# EAGLE design rotor_khamex_4.4 (EAGLE 7.6.0)

## Sheet 1 of 2
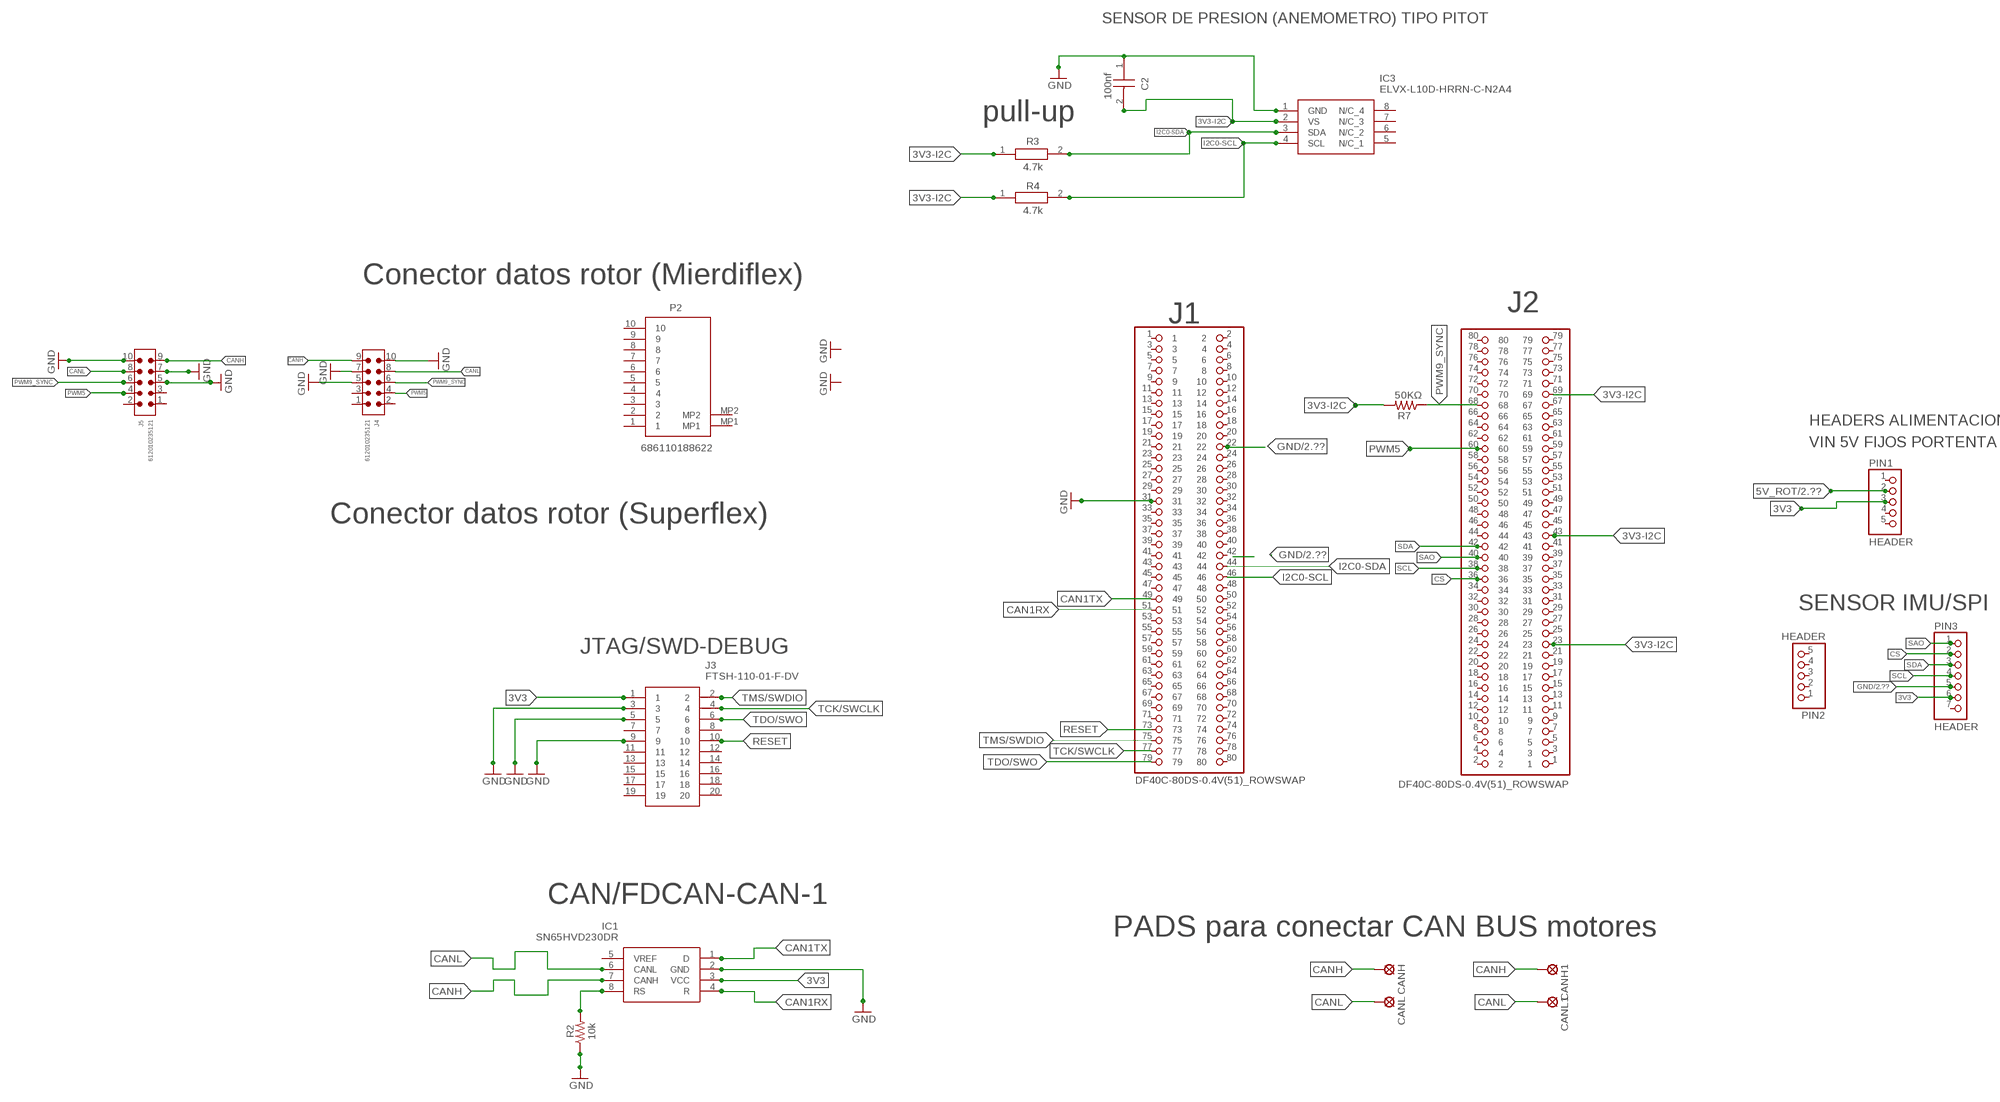
[diagram p0: schematic, sheet 1]

### Parts
C2  100nf  VJ0805Y104KCAAJ  [CAPC2012X145N]
CANH  LSP11  [LSP11]
CANH1  LSP11  [LSP11]
CANL  LSP11  [LSP11]
CANL1  LSP11  [LSP11]
IC1  SN65HVD230DR  [SOT127P600X175-8N]
IC3  ELVX-L10D-HRRN-C-N2A4  [ELVXL10DHRRNCN2A4]
J1  DF40C-80DS-0.4V(51)_ROWSWAP  [HRS_DF40C-80DS-0.4V(51)_ROWSWAP]
J2  DF40C-80DS-0.4V(51)_ROWSWAP  [HRS_DF40C-80DS-0.4V(51)_ROWSWAP]
J3  FTSH-110-01-F-DV  [FTSH-110-XX-YYY-DV]
J4  612010235121  6120XX235121_612010235121  [612010235121]
J5  612010235121  6120XX235121_612010235121  [612010235121]
P2  686110188622  [686110188622]
PIN1  HEADER  PINHD-1X5  [1X05]
PIN2  HEADER  PINHD-1X5  [1X05]
PIN3  HEADER  PINHD-1X7  [1X07]
R2  10k  R-US_M0805  [M0805]
R3  4.7k  CRCW08054K70FKEA  [RESC2012X50N]
R4  4.7k  CRCW08054K70FKEA  [RESC2012X50N]
R7  50KΩ  R-US_M0805  [M0805]

### Nets
3V3: IC1.3(VCC) J3.1 PIN1.3 PIN3.6
3V3-I2C: C2.2 IC3.2(VS) J2.23 J2.43 J2.69 R3.1 R4.1 R7.2
5V_ROT: PIN1.2 ; also sheet 2
CAN1RX: IC1.4(R) J1.51
CAN1TX: IC1.1(D) J1.49
CANH: CANH1.MP CANH.MP IC1.7(CANH) J4.9 J5.9
CANL: CANL1.MP CANL.MP IC1.6(CANL) J4.8 J5.8
CS: J2.36 PIN3.2
GND [power]: C2.1 IC1.2(GND) IC3.1(GND) J1.31 J3.3 J3.5 J3.9 J4.5 J4.7 J4.10 J5.5 J5.7 J5.10 PIN3.5 R2.1 ; also sheet 2
I2C0-SCL: IC3.4(SCL) J1.46 R4.2
I2C0-SDA: IC3.3(SDA) J1.44 R3.2
N$1: J1.22
N$15: IC1.8(RS) R2.2
PWM5: J2.60 J4.4 J5.4
PWM9_SYNC: J2.68 J4.6 J5.6 R7.1
RESET: J1.73 J3.10
SAO: J2.40 PIN3.1
SCL: J2.38 PIN3.4
SDA: J2.42 PIN3.3
TCK/SWCLK: J1.77 J3.4
TDO/SWO: J1.79 J3.6
TMS/SWDIO: J1.75 J3.2
Unconnected: IC1.5(VREF) IC3.5(N/C_1) IC3.6(N/C_2) IC3.7(N/C_3) IC3.8(N/C_4) J1.1 J1.2 J1.3 J1.4 J1.5 J1.6 J1.7 J1.8 J1.9 J1.10 J1.11 J1.12 J1.13 J1.14 J1.15 J1.16 J1.17 J1.18 J1.19 J1.20 J1.21 J1.23 J1.24 J1.25 J1.26 J1.27 J1.28 J1.29 J1.30 J1.32 J1.33 J1.34 J1.35 J1.36 J1.37 J1.38 J1.39 J1.40 J1.41 J1.42 J1.43 J1.45 J1.47 J1.48 J1.50 J1.52 J1.53 J1.54 J1.55 J1.56 J1.57 J1.58 J1.59 J1.60 J1.61 J1.62 J1.63 J1.64 J1.65 J1.66 J1.67 J1.68 J1.69 J1.70 J1.71 J1.72 J1.74 J1.76 J1.78 J1.80 J2.1 J2.2 J2.3 J2.4 J2.5 J2.6 J2.7 J2.8 J2.9 J2.10 J2.11 J2.12 J2.13 J2.14 J2.15 J2.16 J2.17 J2.18 J2.19 J2.20 J2.21 J2.22 J2.24 J2.25 J2.26 J2.27 J2.28 J2.29 J2.30 J2.31 J2.32 J2.33 J2.34 J2.35 J2.37 J2.39 J2.41 J2.44 J2.45 J2.46 J2.47 J2.48 J2.49 J2.50 J2.51 J2.52 J2.53 J2.54 J2.55 J2.56 J2.57 J2.58 J2.59 J2.61 J2.62 J2.63 J2.64 J2.65 J2.66 J2.67 J2.70 J2.71 J2.72 J2.73 J2.74 J2.75 J2.76 J2.77 J2.78 J2.79 J2.80 J3.7 J3.8 J3.11 J3.12 J3.13 J3.14 J3.15 J3.16 J3.17 J3.18 J3.19 J3.20 J4.1 J4.2 J4.3 J5.1 J5.2 J5.3 P2.1 P2.2 P2.3 P2.4 P2.5 P2.6 P2.7 P2.8 P2.9 P2.10 P2.MP1 P2.MP2 PIN1.1 PIN1.4 PIN1.5 PIN2.1 PIN2.2 PIN2.3 PIN2.4 PIN2.5 PIN3.7

### Notes on the sheet
- SENSOR DE PRESION (ANEMOMETRO) TIPO PITOT
- pull-up
- 4.7k
- 4.7k
- Conector datos rotor (Mierdiflex)
- HEADERS ALIMENTACION
- VIN 5V FIJOS PORTENTA
- Conector datos rotor (Superflex)
- SENSOR IMU/SPI
- JTAG/SWD-DEBUG
- CAN/FDCAN-CAN-1
- PADS para conectar CAN BUS motores

## Sheet 2 of 2
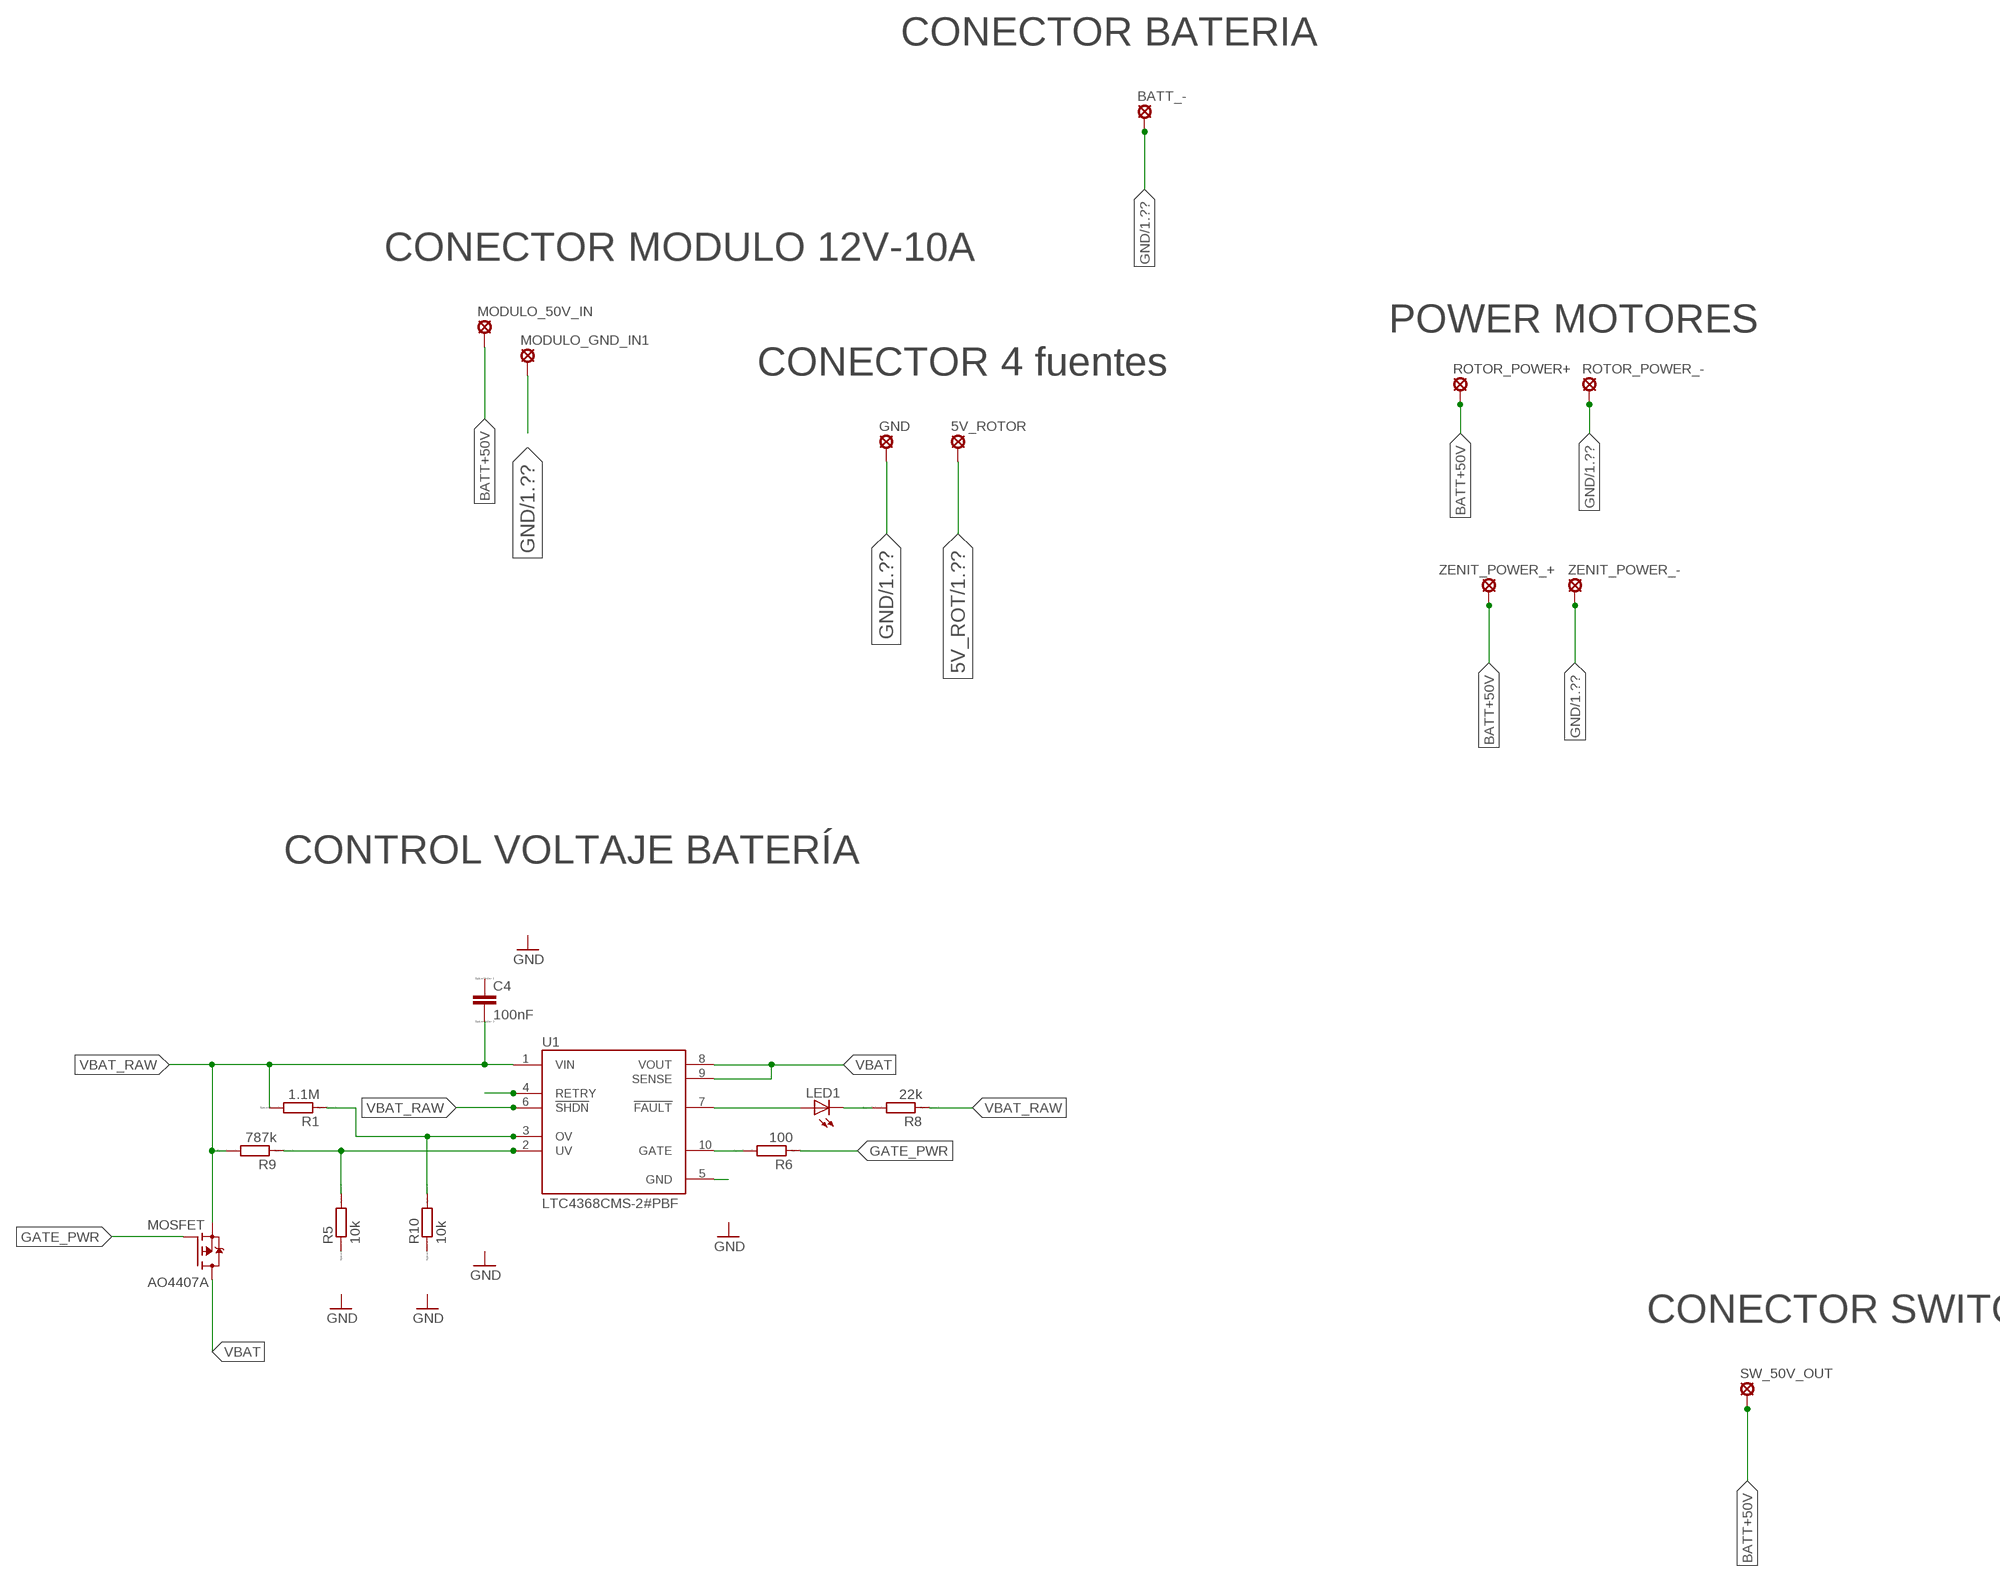
[diagram p1: schematic, sheet 2]

### Parts
5V_ROTOR  SE14  [SE14]
BATT_-  SE14  [SE14]
C4  100nF  C  [C0805]
GND  SE14  [SE14]
LED1  LED  [SMARTLED-TTW]
MODULO_50V_IN  SE14  [SE14]
MODULO_GND_IN1  SE14  [SE14]
MOSFET  AO4407A  [SOIC127P600X175-8N]
R1  1.1M  R  [R0805]
R5  10k  R  [R0805]
R6  100  R  [R0805]
R8  22k  R  [R0805]
R9  787k  R  [R0805]
R10  10k  R  [R0805]
ROTOR_POWER+  SE14  [SE14]
ROTOR_POWER_-  SE14  [SE14]
SW_50V_OUT  SE14  [SE14]
U1  LTC4368CMS-2#PBF  [SOP50P490X110-10N]
ZENIT_POWER_+  SE14  [SE14]
ZENIT_POWER_-  SE14  [SE14]

### Nets
5V_ROT: 5V_ROTOR.MP ; also sheet 1
BATT+50V [power]: MODULO_50V_IN.MP ROTOR_POWER+.MP SW_50V_OUT.MP ZENIT_POWER_+.MP
GATE_PWR: MOSFET.4(G) R6.1
GND [power]: BATT_-.MP GND.MP MODULO_GND_IN1.MP ROTOR_POWER_-.MP ZENIT_POWER_-.MP ; also sheet 1
N$2: LED1.A@1(A) U1.7(!FAULT)
N$11: R5.2 R9.1 U1.2(UV)
N$12: R1.1 R10.2 U1.3(OV)
N$13: LED1.C@1(C) R8.2
N$14: R6.2 U1.10(GATE)
N$20 [power]: U1.4(RETRY)
N$21 [power]: U1.5(GND)
VBAT: MOSFET.5(D) MOSFET.6(D) MOSFET.7(D) MOSFET.8(D) U1.8(VOUT) U1.9(SENSE)
VBAT_RAW: C4.2 MOSFET.1(S) MOSFET.2(S) MOSFET.3(S) R1.2 R8.1 R9.2 U1.1(VIN) U1.6(!SHDN)
Unconnected: C4.1 R5.1 R10.1

### Notes on the sheet
- CONECTOR BATERIA
- CONECTOR MODULO 12V-10A
- POWER MOTORES
- CONECTOR 4 fuentes
- CONTROL VOLTAJE BATERÍA
- CONECTOR SWITCH

## Library data of the parts
5V_ROTOR BATT_- GND MODULO_50V_IN MODULO_GND_IN1 ROTOR_POWER+ ROTOR_POWER_- SW_50V_OUT ZENIT_POWER_+ ZENIT_POWER_- = solpad:SE14: SOLDER PAD E1553, drill 1,4mm, distributor Buerklin, 07F820
C2 = VJ0805Y104KCAAJ:VJ0805Y104KCAAJ: Vishay VJ0805 series Capacitor Chips Source: Datasheet <http://www.vishay.com/docs/45226/vj31xrohsautomlcc.pdf>; DESCRIPTION: Vishay VJ0805 series Capacitor Chips; HEIGHT: 1.45mm; MANUFACTURER_NAME: Vishay; MANUFACTURER_PART_NUMBER: VJ0805Y104KCAAJ
C4 = eagle-ltspice:C: CAPACITOR, European symbol; SPICEMODEL: NONE; SPICEPREFIX: C
CANH CANH1 CANL CANL1 = solpad:LSP11: SOLDER PAD drill 1.1 mm
IC1 = SN65HVD230DR:SN65HVD230DR: 3.3 V CAN Transceiver with Standby Mode Source: Datasheet <http://www.ti.com/lit/gpn/sn65hvd230>; DESCRIPTION: 3.3 V CAN Transceiver with Standby Mode; HEIGHT: 1.75mm; MANUFACTURER_NAME: Texas Instruments; MANUFACTURER_PART_NUMBER: SN65HVD230DR; MOUSER_PART_NUMBER: 595-SN65HVD230DR; MOUSER_PRICE-STOCK: https://www.mouser.co.uk/ProductDetail/Texas-Instruments/SN65HVD230DR?qs=QViXGNcIEAtifeQR3pYVUQ%3D%3D
IC3 = ELVX-L10D-HRRN-C-N2A4:ELVX-L10D-HRRN-C-N2A4: Pressure Sensor +/-0.36PSI (+/-2.49kPa) Differential Male - 0.08" (1.93mm) Tube, Dual 14 b 8-SMD, No Lead, Dual Ports, Same Side, 3.3V, -25C ~ 85C Source: Datasheet <https://allsensors.com/hubfs/Product-Data-Sheets/DS-0452.pdf>; DESCRIPTION: Pressure Sensor +/-0.36PSI (+/-2.49kPa) Differential Male - 0.08" (1.93mm) Tube, Dual 14 b 8-SMD, No Lead, Dual Ports, Same Side, 3.3V, -25C ~ 85C; HEIGHT: 4.33mm; MANUFACTURER_NAME: Amphenol; MANUFACTURER_PART_NUMBER: ELVX-L10D-HRRN-C-N2A4
J1 J2 = DF40C-80DS-0.4V_51_ROWSWAP:DF40C-80DS-0.4V(51)_ROWSWAP; CHECK_PRICES: https://www.snapeda.com/parts/DF40C-80DS-0.4V(51)/Hirose/view-part/?ref=eda; DESCRIPTION: Receptáculo del conector de la posición 80, contactos de la tira central Montaje en superficie Oro; DIGIKEY_PART_NUMBER: H11633CT-ND; MF: Hirose; MP: DF40C-80DS-0.4V(51); PACKAGE: None; SNAPEDA_LINK: https://www.snapeda.com/parts/DF40C-80DS-0.4V(51)/Hirose/view-part/?ref=snap
J3 = FTSH-110-01-F-DV:FTSH-110-01-F-DV: 20 Position, High Reliability Header Strips, 0.050" pitch Source: Datasheet <http://suddendocs.samtec.com/prints/ftsh-1xx-xx-xxx-dv-xxx-xxx-mkt.pdf>; DESCRIPTION: 20 Position, High Reliability Header Strips, 0.050&quot; pitch; HEIGHT: mm; MANUFACTURER_NAME: SAMTEC; MANUFACTURER_PART_NUMBER: FTSH-110-01-F-DV; MOUSER_PART_NUMBER: 200-FTSH11001FDV; MOUSER_PRICE-STOCK: https://www.mouser.co.uk/ProductDetail/Samtec/FTSH-110-01-F-DV?qs=92ilVni64gw1JaTDl9rCLg%3D%3D
J4 J5 = Eagle_WR-BHD_rev24a:6120XX235121_612010235121: WR-BHD 2.54 mm Male Box Header High Temperature KIND PROPERTIES: Pitch 2.54 mm Gender:Male MATERIAL PROPERTIES: Insulator Material:PA6T Insulator Flammability Rating UL94 V-0 Insulator Color:Black Contact Material :Copper Alloy Contact Plating :Gold Contact Type: Stamped GENERAL INFORMATION: Operating Temperature:-40 °C up to +125 °C Compliance:RoHS Working Voltage: 250 V (AC) Withstanding Voltage:500 V (AC) Contact Resistance: 20 mΩ Insulation Resistance:1000 MΩ PACKAGING PROPERTIES Packaging :Tray <https://www.we-online.com/catalog/media/o32904v209%20Family_WR-BHD_6120xx235121.jpg> Details see: https://www.we-online.com/catalog/en/BHD_2_54_MALE_BOX_HEADER_HIGH_TEMPERATURE_6120XX235121 Updated by Ella Wu 2021-03-12 2021 (C) Würth Elektronik; CONTACT-RESISTANCE: 20mOhm; DATASHEET-URL: https://www.we-online.com/redexpert/spec/612010235121?ae; GENDER: Male; IR: 3A; LENGTH: 20.3mm; MOUNT: THT; PACKAGING: Tray; PART-NUMBER: 612010235121; PINS: 10; PITCH: 2.54mm; TYPE: Straight; WORKING-VOLTAGE: 250V(AC)
LED1 = led:LED: LED OSRAM: - CHIPLED LG R971, LG N971, LY N971, LG Q971, LY Q971, LO R971, LY R971 LH N974, LH R974 LS Q976, LO Q976, LY Q976 LO Q996 - Hyper CHIPLED LW Q18S LB Q993, LB Q99A, LB R99A - SideLED LS A670, LO A670, LY A670, LG A670, LP A670 LB A673, LV A673, LT A673, LW A673 LH A674 LY A675 LS A676, LA A676, LO A676, LY A676, LW A676 LS A679, LY A679, LG A679 - Hyper Micro SIDELED® LS Y876, LA Y876, LO Y876, LY Y876 LT Y87S - SmartLED LW L88C, LW L88S LB L89C, LB L89S, LG L890 LS L89K, LO L89K, LY L89K LS L896, LA L896, LO L896, LY L896 - TOPLED LS T670, LO T670, LY T670, LG T670, LP T670 LSG T670, LSP T670, LSY T670, LOP T670, LYG T670 LG T671, LOG T671, LSG T671 LB T673, LV T673, LT T673, LW T673 LH T674 LS T676, LA T676, LO T676, LY T676, LB T676, LH T676, LSB T676, LW T676 LB T67C, LV T67C, LT T67C, LS T67K, LO T67K, LY T67K, LW E67C LS E67B, LA E67B, LO E67B, LY E67B, LB E67C, LV E67C, LT E67C LW T67C LS T679, LY T679, LG T679 LS T770, LO T770, LY T770, LG T770, LP T770 LB T773, LV T773, LT T773, LW T773 LH T774 LS E675, LA E675, LY E675, LS T675 LS T776, LA T776, LO T776, LY T776, LB T776 LHGB T686 LT T68C, LB T68C - Hyper Mini TOPLED® LB M676 - Mini TOPLED Santana® LG M470 LS M47K, LO M47K, LY M47K Source: http://www.osram.convergy.de LUXEON: - LUMILED® LXK2-PW12-R00, LXK2-PW12-S00, LXK2-PW14-U00, LXK2-PW14-V00 LXK2-PM12-R00, LXK2-PM12-S00, LXK2-PM14-U00 LXK2-PE12-Q00, LXK2-PE12-R00, LXK2-PE12-S00, LXK2-PE14-T00, LXK2-PE14-U00 LXK2-PB12-K00, LXK2-PB12-L00, LXK2-PB12-M00, LXK2-PB14-N00, LXK2-PB14-P00, LXK2-PB14-Q00 LXK2-PR12-L00, LXK2-PR12-M00, LXK2-PR14-Q00, LXK2-PR14-R00 LXK2-PD12-Q00, LXK2-PD12-R00, LXK2-PD12-S00 LXK2-PH12-R00, LXK2-PH12-S00 LXK2-PL12-P00, LXK2-PL12-Q00, LXK2-PL12-R00 Source: www.luxeon.com KINGBRIGHT: KA-3528ASYC Source: www.kingbright.com
MOSFET = AO4407A:AO4407A: Check availability <https://pricing.snapeda.com/parts/AO4407A/Alpha%20%26/view-part?ref=eda>; AVAILABILITY: In Stock; CHECK_PRICES: https://www.snapeda.com/parts/AO4407A/Alpha/view-part/?ref=eda; DESCRIPTION: P-Channel 30 V 12A (Ta) 3.1W (Ta) Surface Mount 8-SOIC; MF: Alpha &; MP: AO4407A; PACKAGE: SOIC-8 Alpha &amp; Omega Semiconductor; PRICE: None; SNAPEDA_LINK: https://www.snapeda.com/parts/AO4407A/Alpha/view-part/?ref=snap
P2 = 686110188622:686110188622: FFC & FPC Connectors WR-FPC 1,0mm SMT Horiz. Top Contact Tin Plating{0000} Source: Datasheet <https://www.mouser.ch/datasheet/2/445/686110188622-1843591.pdf>; DESCRIPTION: FFC & FPC Connectors WR-FPC 1,0mm SMT Horiz. Top Contact Tin Plating{0000}; HEIGHT: 3.3mm; MANUFACTURER_NAME: Wurth Elektronik; MANUFACTURER_PART_NUMBER: 686110188622; MOUSER_PART_NUMBER: 710-686110188622; MOUSER_PRICE-STOCK: https://www.mouser.co.uk/ProductDetail/Wurth-Elektronik/686110188622?qs=OlC7AqGiEDnHUpT6yh27Lg%3D%3D
PIN1 PIN2 = pinhead:PINHD-1X5: PIN HEADER
PIN3 = pinhead:PINHD-1X7: PIN HEADER
R1 R5 R6 R8-R10 = eagle-ltspice:R: RESISTOR, European symbol; SPICEMODEL: NONE; SPICEPREFIX: R
R2 R7 = rcl:R-US_: RESISTOR, American symbol
R3 R4 = CRCW08054K70FKEA:CRCW08054K70FKEA: Vishay CRCW Series Thick Film Surface Mount Resistor 805 Case 4.7k +/-1% 0.125W +/-100ppm/C Source: Datasheet <http://www.vishay.com/docs/20035/dcrcwe3.pdf>; DESCRIPTION: Vishay CRCW Series Thick Film Surface Mount Resistor 805 Case 4.7k +/-1% 0.125W +/-100ppm/C; HEIGHT: 0.5mm; MANUFACTURER_NAME: Vishay; MANUFACTURER_PART_NUMBER: CRCW08054K70FKEA; MOUSER_PART_NUMBER: 71-CRCW0805-4.7K-E3; MOUSER_PRICE-STOCK: https://www.mouser.co.uk/ProductDetail/Vishay-Dale/CRCW08054K70FKEA?qs=kkyyugUlSrMIzNiWjd4LGQ%3D%3D
U1 = LTC4368CMS-2_PBF:LTC4368CMS-2#PBF: Check availability <https://pricing.snapeda.com/parts/LTC4368CMS-2%23PBF/Analog%20Devices/view-part?ref=eda>; AVAILABILITY: In Stock; CHECK_PRICES: https://www.snapeda.com/parts/LTC4368CMS-2%23PBF/Analog+Devices/view-part/?ref=eda; DESCRIPTION: 100V UV/OV and Reverse Protection Controller with Bidirectional Circuit Breaker; MF: Analog Devices; MP: LTC4368CMS-2#PBF; PACKAGE: MSOP-10 Analog Devices; PRICE: None; SNAPEDA_LINK: https://www.snapeda.com/parts/LTC4368CMS-2%23PBF/Analog+Devices/view-part/?ref=snap

## Net classes
0 default: width 0.152 mm, drill 0.305 mm, clearance 0.152 mm
1 power: width 0.127 mm, drill 0.305 mm, clearance 0.127 mm
2 thin: width 0.508 mm, drill 0.305 mm, clearance 0.152 mm

## Board
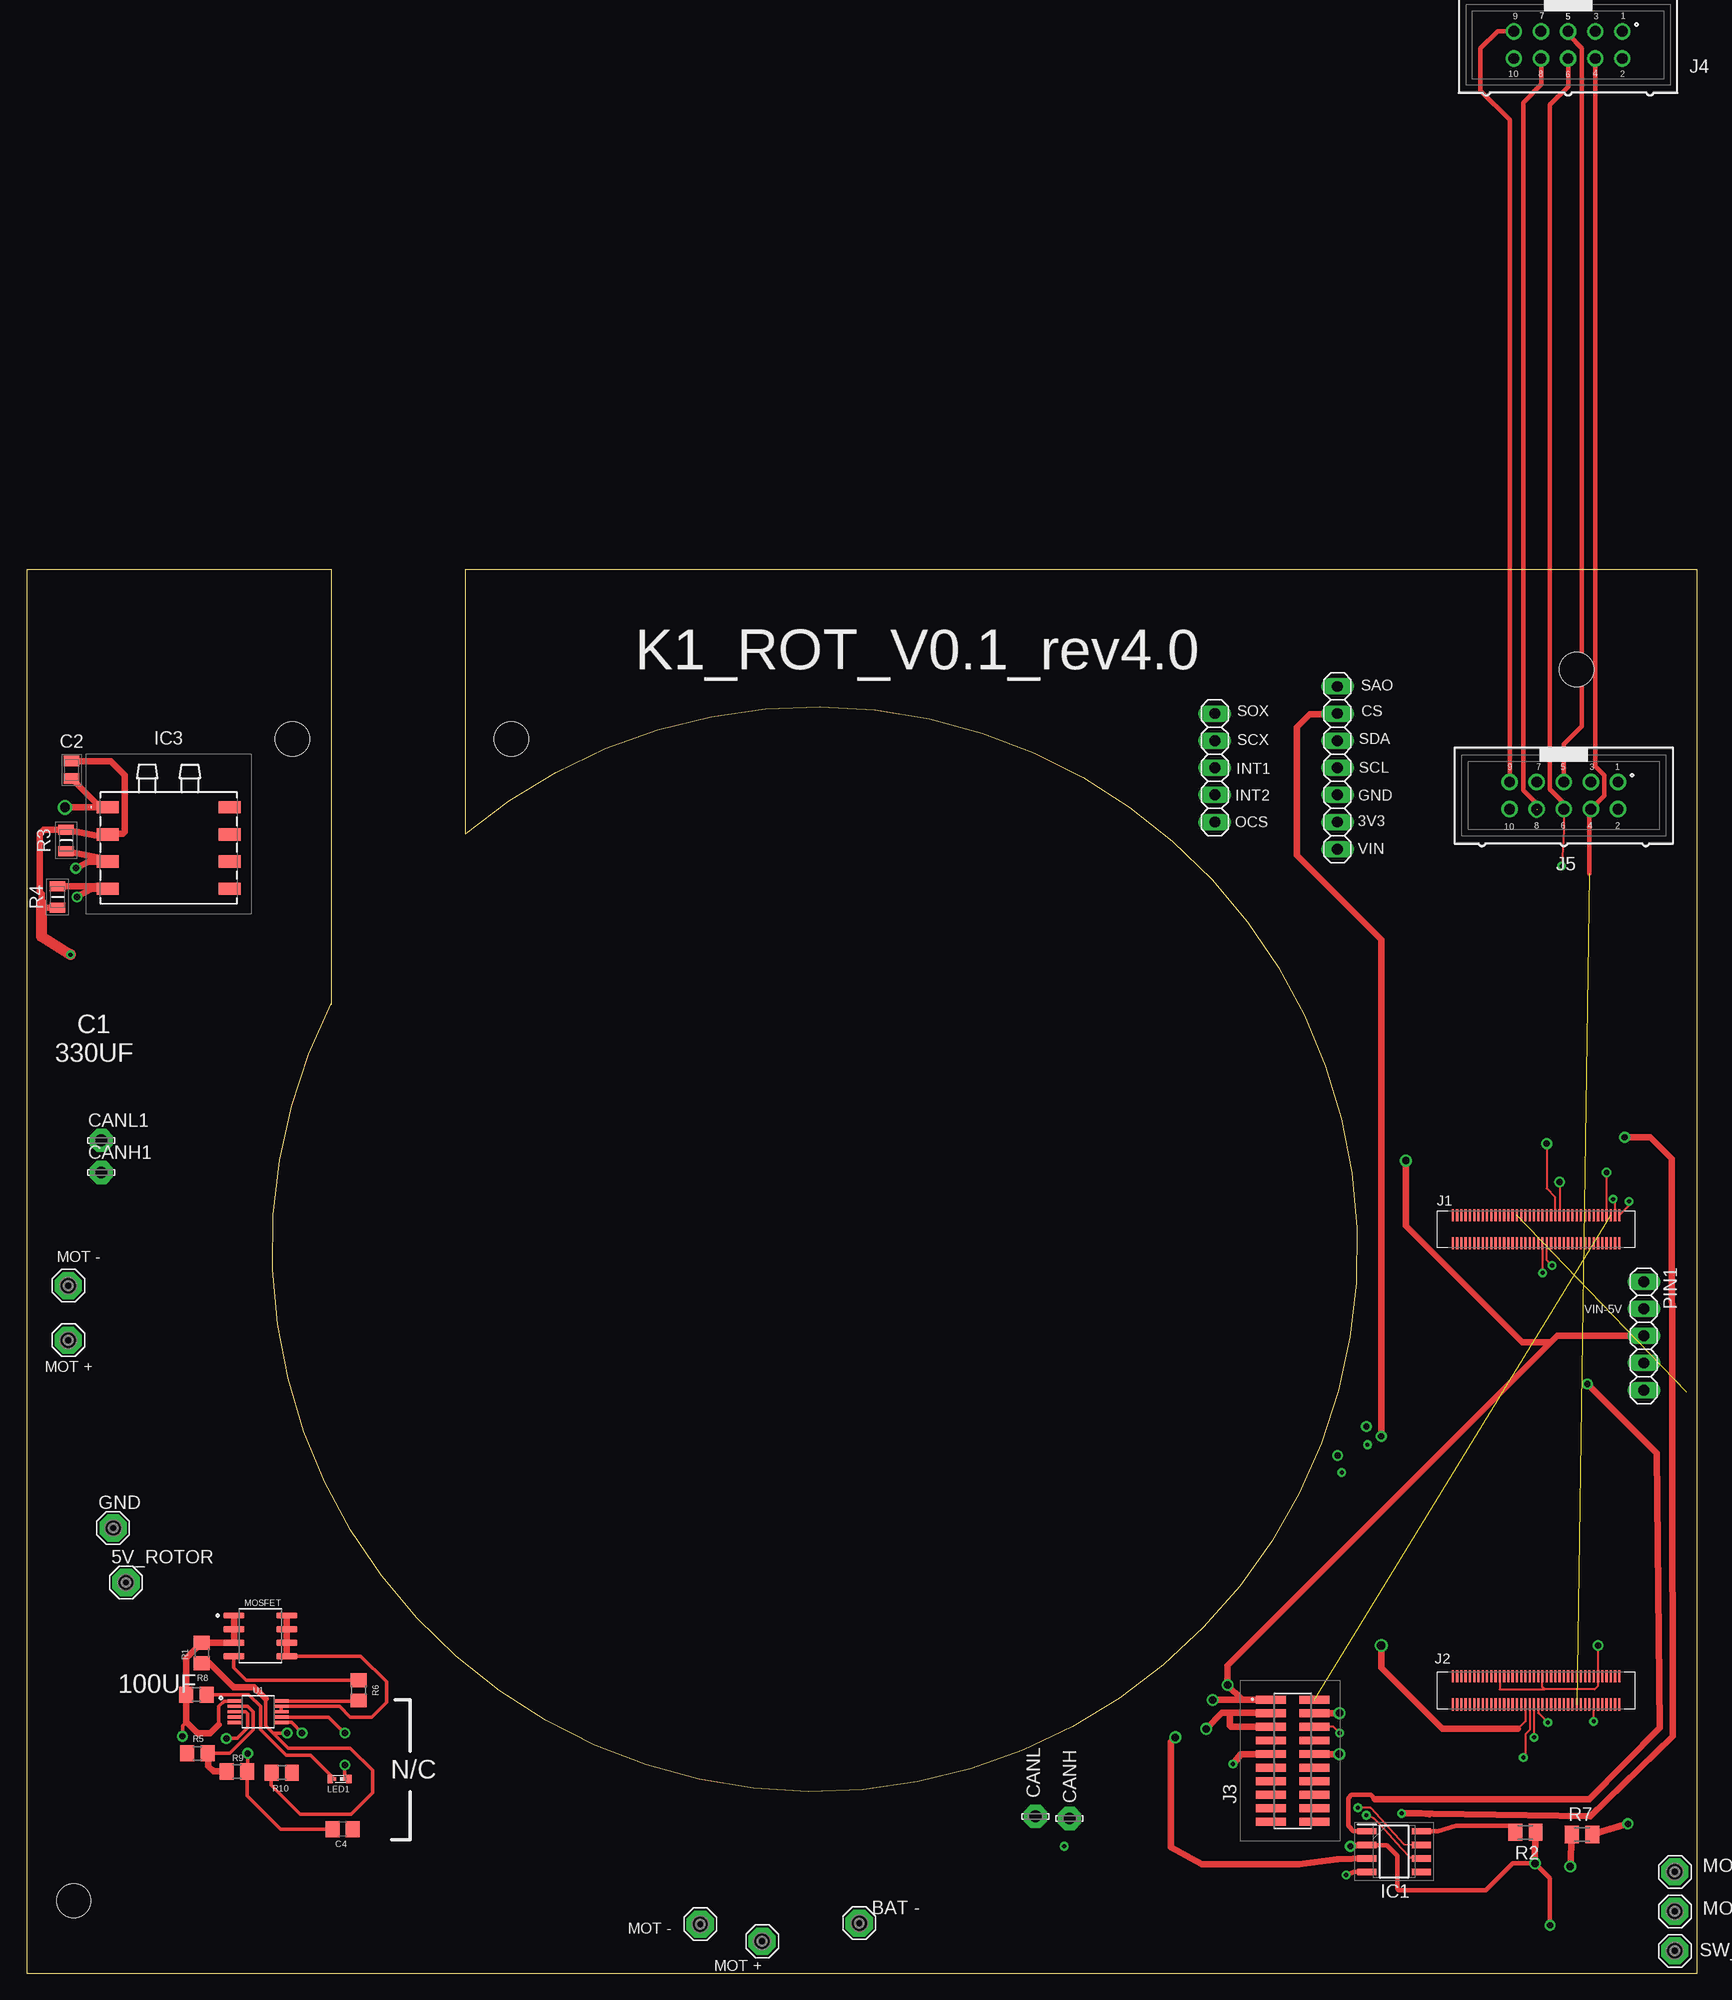
[diagram p2: board, top side]
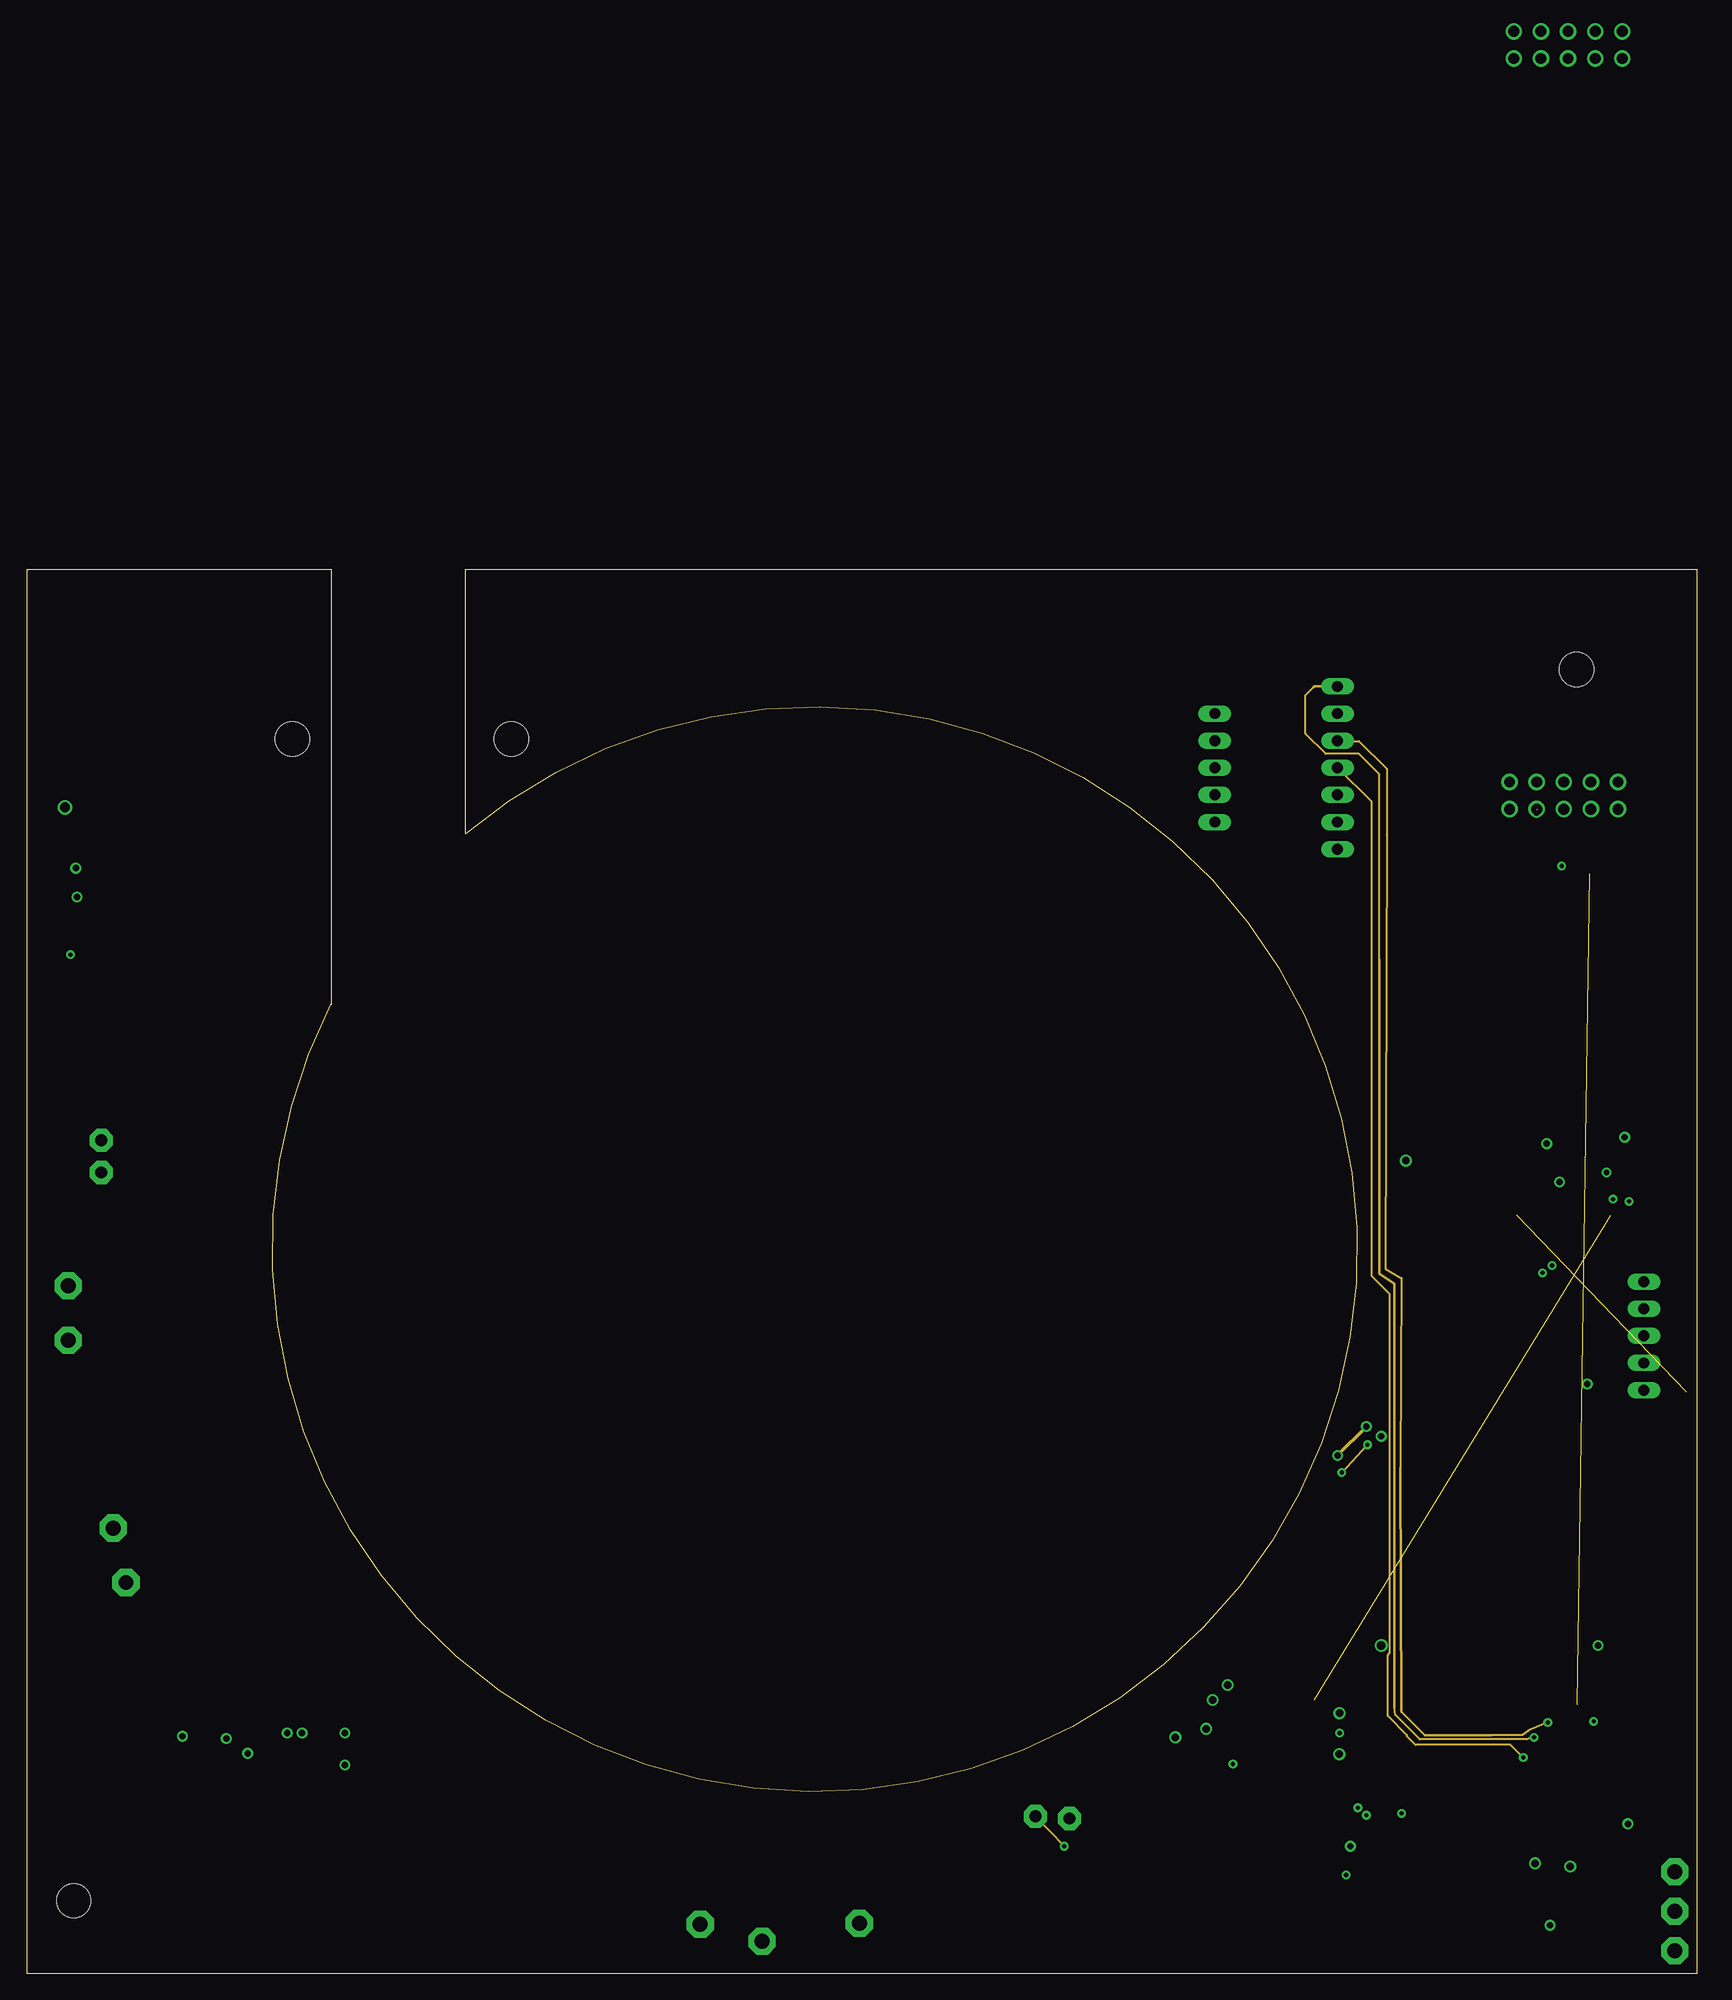
[diagram p3: board, inner layer Route2]
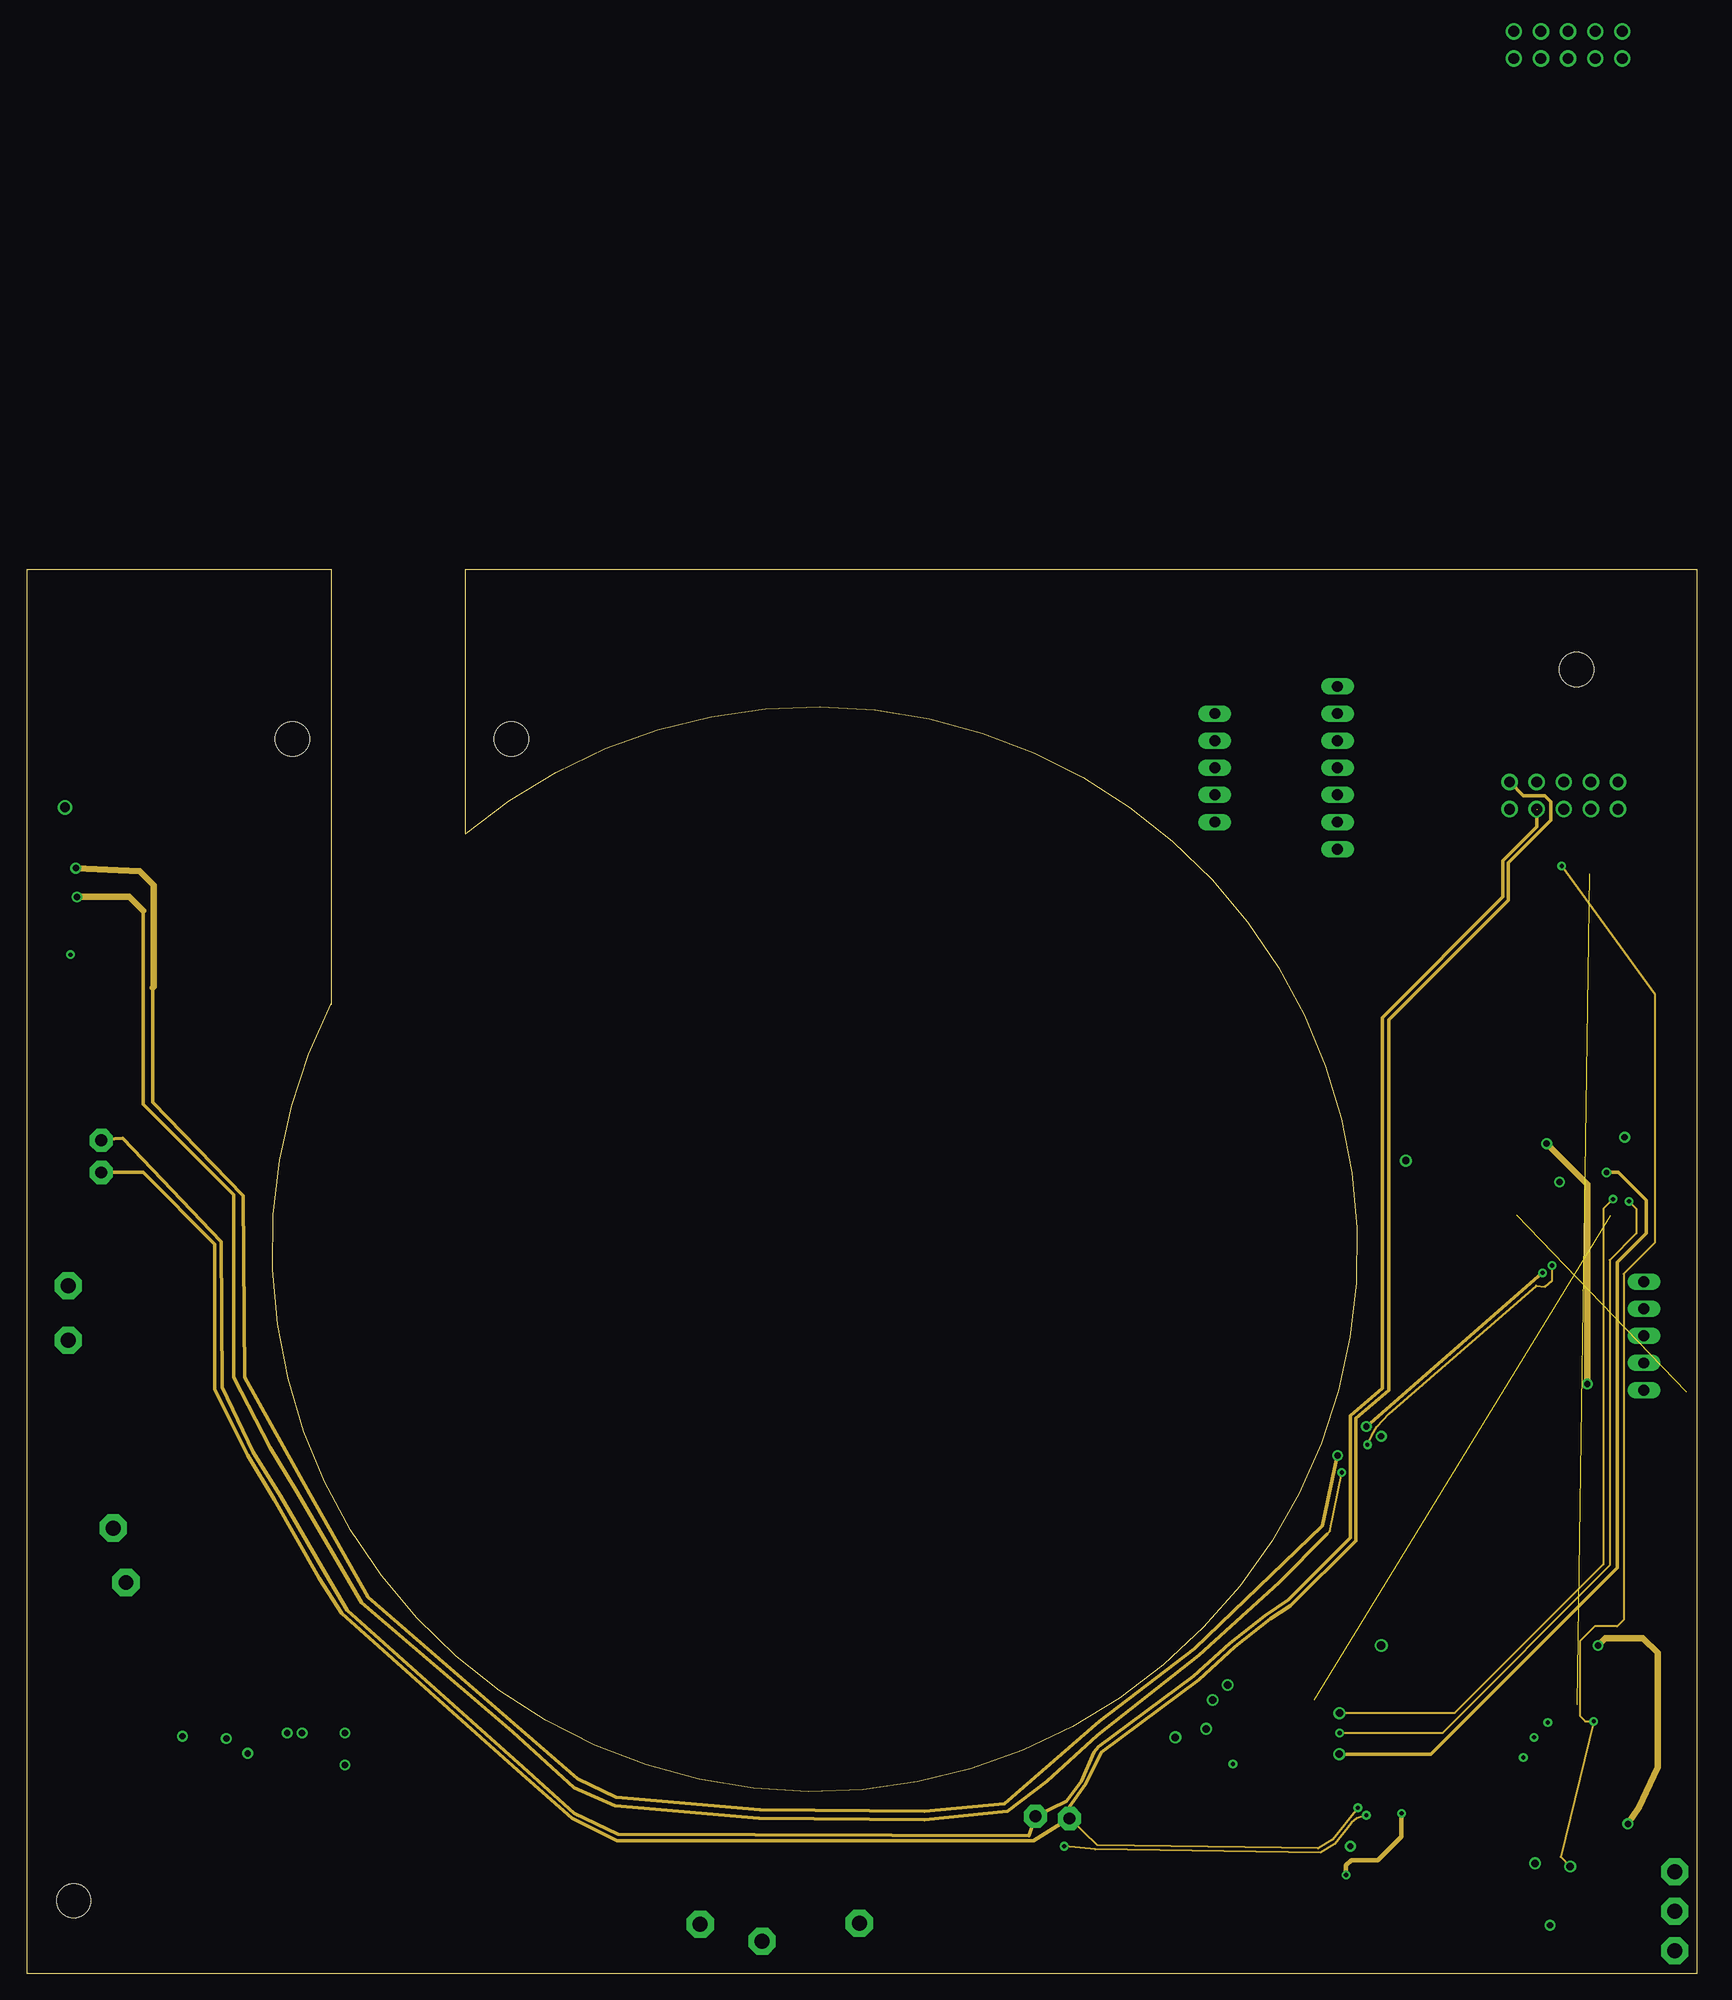
[diagram p4: board, inner layer Route15]
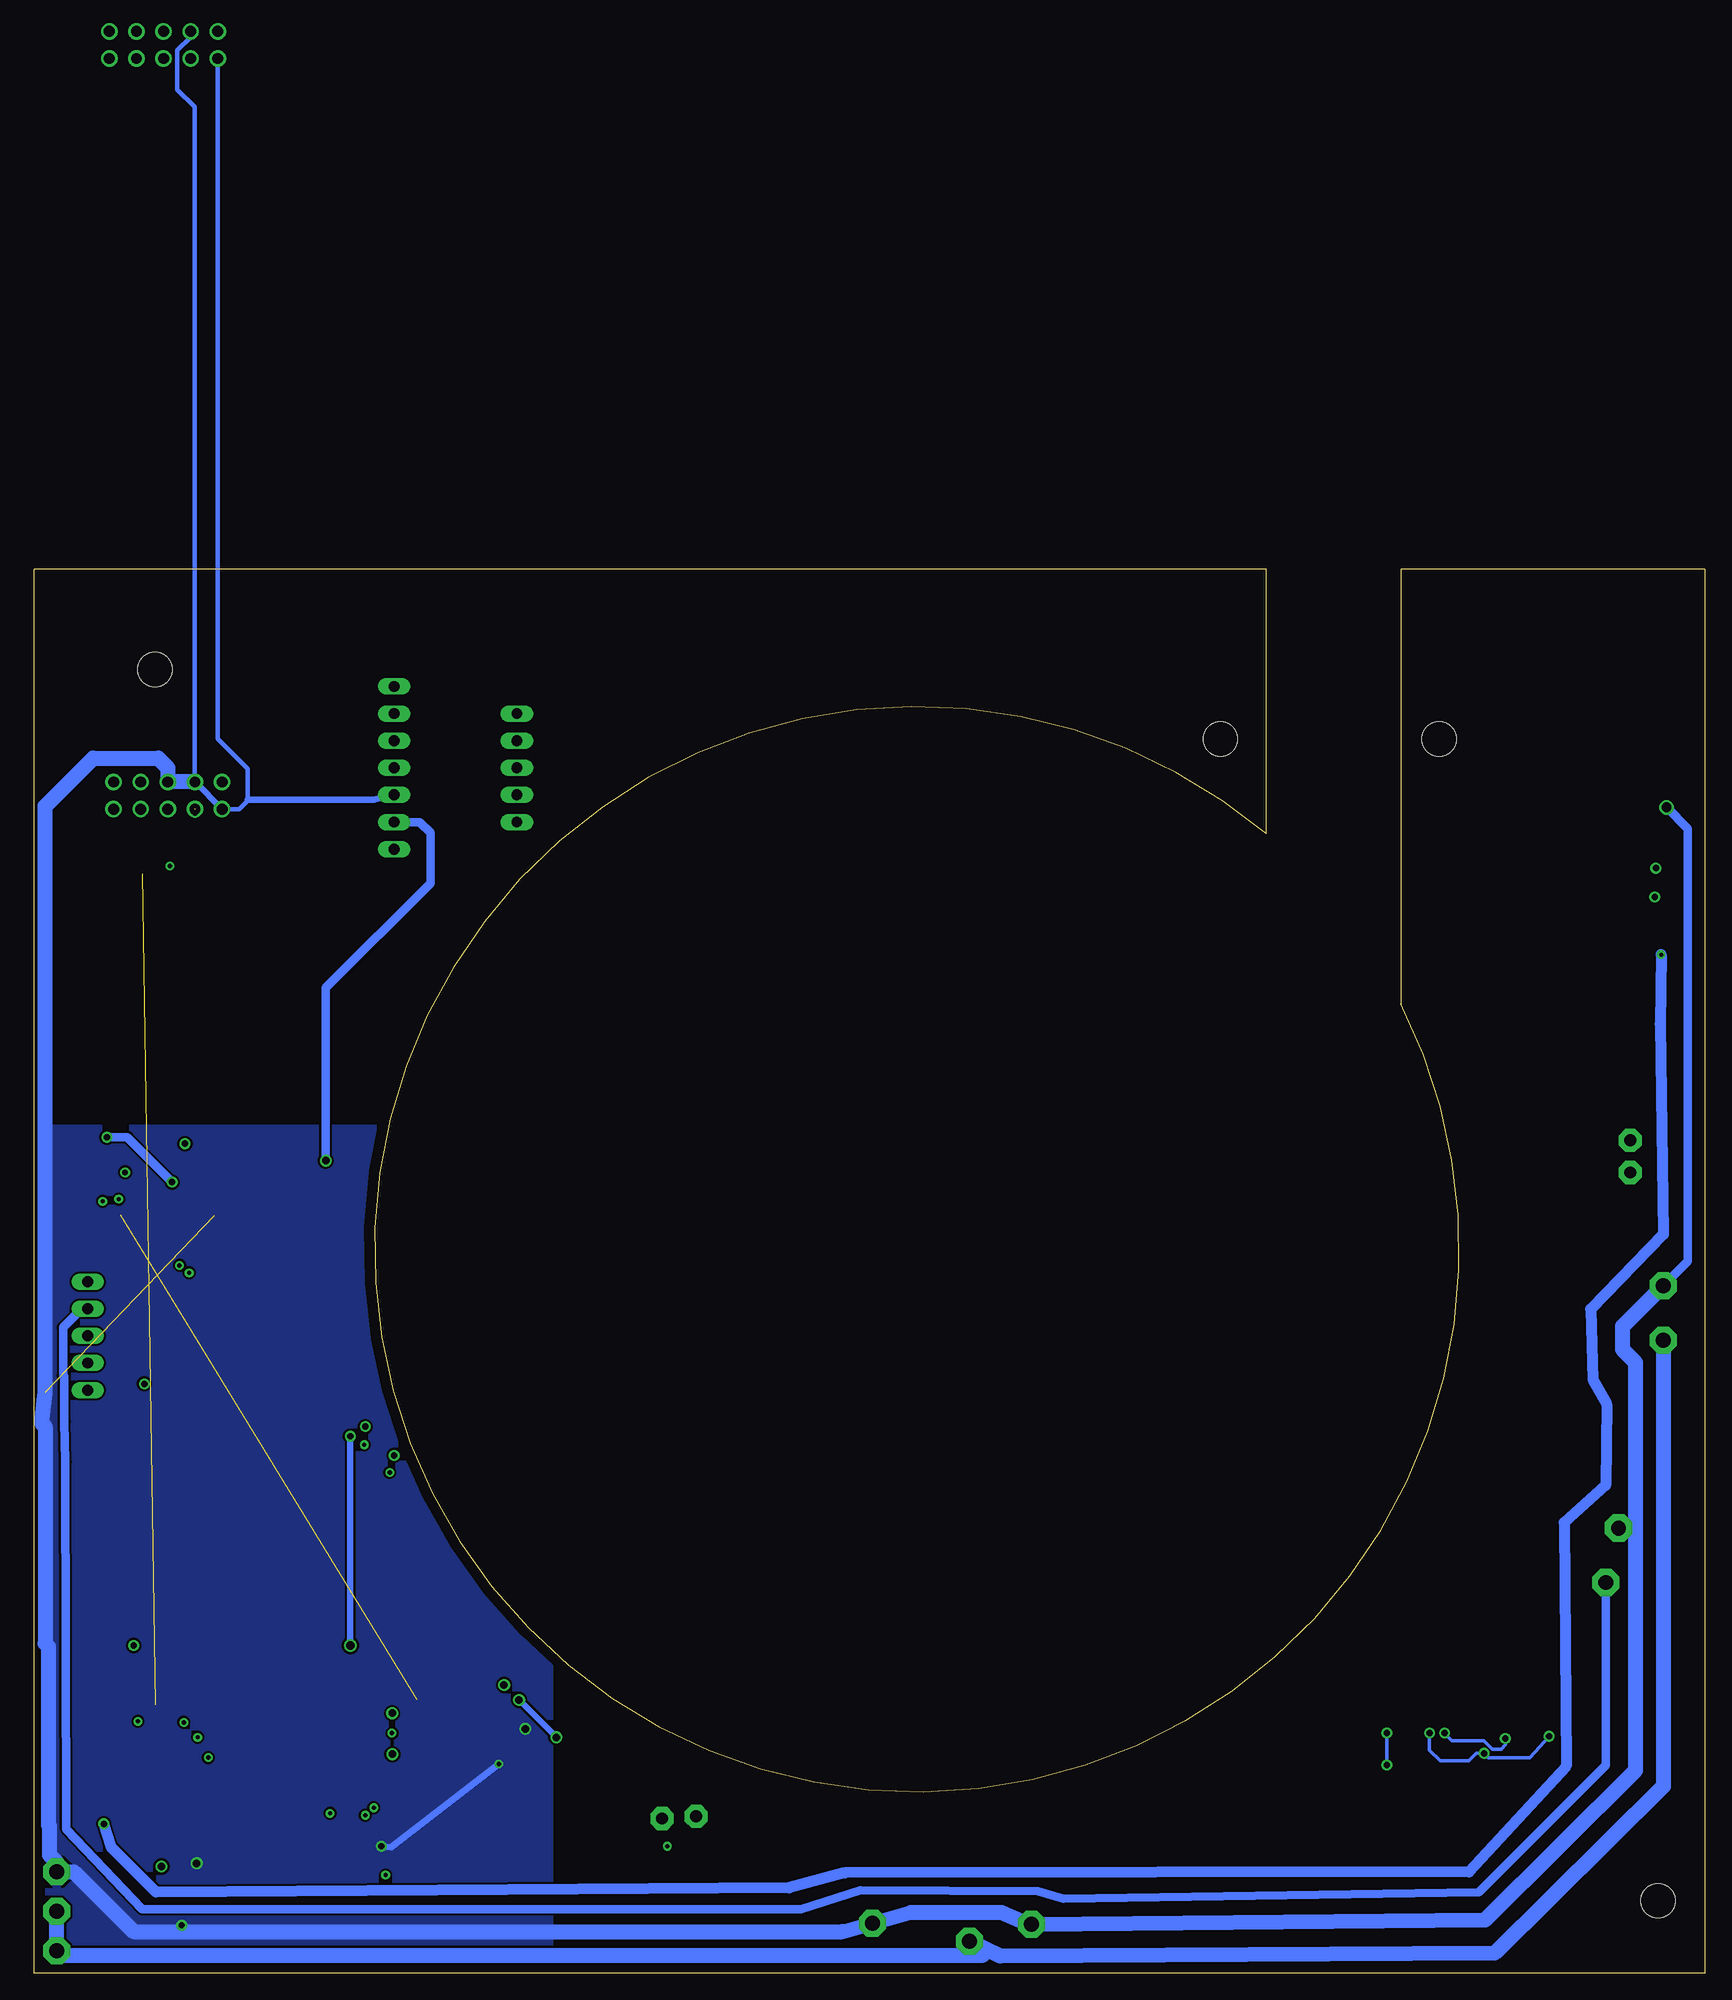
[diagram p5: board, bottom side, seen from below]

Size 156.5 x 131.5 mm. Coordinates in mm from the lower left corner, seen from the top.
Outline: 28.5,90.8 28.5,131.5 0,131.5 0,0 156.5,0 156.5,131.5 41.1,131.5 41.1,106.7 arc-337 28.5,90.8
Outline: 28.5,90.8 28.5,90.7
Copper layers (1*16): Top 0.035mm / dielectric 1.5mm / Bottom 0.035mm
Design rules "default": minimum track width 10mil, minimum drill 24mil, track to track 8mil, track to pad 8mil, pad to pad 8mil, via to via 8mil, smd to smd 8mil, copper to edge 40mil, drill to drill 8mil, minimum pad ring 10mil, minimum via ring 8mil, stop-mask expansion 4mil, vias tented up to drill 0mil, thermal gap 10mil
Holes 3.2 mm at 145.2,122.1 4.4,6.8 24.9,115.6 45.4,115.6

### Footprints (pad centres in the part's own frame; a part is rotated, then mirrored left to right if it is on the bottom)
SE14 = drill 1.397 pad 2.54 octagon: MP 0,0
CAPC2012X145N = smd 0.99 x 1.47: 1 -0.82,0; 2 0.82,0
C0805 = smd 1.3 x 1.5: 1 -0.95,0; 2 0.95,0
LSP11 = drill 1.118 pad 2.159 octagon: MP 0,0
SOT127P600X175-8N = smd 1.75 x 0.6: 1 -2.55,1.905; 2 -2.55,0.635; 3 -2.55,-0.635; 4 -2.55,-1.905; 5 2.55,-1.905; 6 2.55,-0.635; 7 2.55,0.635; 8 2.55,1.905
ELVXL10DHRRNCN2A4 = smd 2.03 x 1.14: 1 -5.715,2.5; 2 -5.715,-0.04; 3 -5.715,-2.58; 4 -5.715,-5.12; 5 5.715,-5.12; 6 5.715,-2.58; 7 5.715,-0.04; 8 5.715,2.5
HRS_DF40C-80DS-0.4V(51)_ROWSWAP = smd 0.2 x 1.14: 1 -7.8,1.32; 2 -7.8,-1.32; 3 -7.4,1.32; 4 -7.4,-1.32; 5 -7,1.32; 6 -7,-1.32; 7 -6.6,1.32; 8 -6.6,-1.32; 9 -6.2,1.32; 10 -6.2,-1.32; 11 -5.8,1.32; 12 -5.8,-1.32; 13 -5.4,1.32; 14 -5.4,-1.32; 15 -5,1.32; 16 -5,-1.32; 17 -4.6,1.32; 18 -4.6,-1.32; 19 -4.2,1.32; 20 -4.2,-1.32; 21 -3.8,1.32; 22 -3.8,-1.32; 23 -3.4,1.32; 24 -3.4,-1.32; 25 -3,1.32; 26 -3,-1.32; 27 -2.6,1.32; 28 -2.6,-1.32; 29 -2.2,1.32; 30 -2.2,-1.32; 31 -1.8,1.32; 32 -1.8,-1.32; 33 -1.4,1.32; 34 -1.4,-1.32; 35 -1,1.32; 36 -1,-1.32; 37 -0.6,1.32; 38 -0.6,-1.32; 39 -0.2,1.32; 40 -0.2,-1.32; 41 0.2,1.32; 42 0.2,-1.32; 43 0.6,1.32; 44 0.6,-1.32; 45 1,1.32; 46 1,-1.32; 47 1.4,1.32; 48 1.4,-1.32; 49 1.8,1.32; 50 1.8,-1.32; 51 2.2,1.32; 52 2.2,-1.32; 53 2.6,1.32; 54 2.6,-1.32; 55 3,1.32; 56 3,-1.32; 57 3.4,1.32; 58 3.4,-1.32; 59 3.8,1.32; 60 3.8,-1.32; 61 4.2,1.32; 62 4.2,-1.32; 63 4.6,1.32; 64 4.6,-1.32; 65 5,1.32; 66 5,-1.32; 67 5.4,1.32; 68 5.4,-1.32; 69 5.8,1.32; 70 5.8,-1.32; 71 6.2,1.32; 72 6.2,-1.32; 73 6.6,1.32; 74 6.6,-1.32; 75 7,1.32; 76 7,-1.32; 77 7.4,1.32; 78 7.4,-1.32; 79 7.8,1.32; 80 7.8,-1.32
FTSH-110-XX-YYY-DV = smd 0.74 x 2.79: 1 -5.715,-2.035; 2 -5.715,2.035; 3 -4.445,-2.035; 4 -4.445,2.035; 5 -3.175,-2.035; 6 -3.175,2.035; 7 -1.905,-2.035; 8 -1.905,2.035; 9 -0.635,-2.035; 10 -0.635,2.035; 11 0.635,-2.035; 12 0.635,2.035; 13 1.905,-2.035; 14 1.905,2.035; 15 3.175,-2.035; 16 3.175,2.035; 17 4.445,-2.035; 18 4.445,2.035; 19 5.715,-2.035; 20 5.715,2.035
612010235121 = drill 1.02: 1 -5.08,-1.27; 2 -5.08,1.27; 3 -2.54,-1.27; 4 -2.54,1.27; 5 0,-1.27; 6 0,1.27; 7 2.54,-1.27; 8 2.54,1.27; 9 5.08,-1.27; 10 5.08,1.27
SMARTLED-TTW = smd 0.8 x 0.5: A 0,-0.875; C 0,0.875 | smd 0.35 x 0.35: A@1 0,-0.5; C@1 0,0.5
SOIC127P600X175-8N = smd 1.97 x 0.6: 1 -2.475,1.905; 2 -2.475,0.635; 3 -2.475,-0.635; 4 -2.475,-1.905; 5 2.475,-1.905; 6 2.475,-0.635; 7 2.475,0.635; 8 2.475,1.905
686110188622 = smd 0.6 x 1.9: 1 -4.5,2.825; 2 -3.5,2.825; 3 -2.5,2.825; 4 -1.5,2.825; 5 -0.5,2.825; 6 0.5,2.825; 7 1.5,2.825; 8 2.5,2.825; 9 3.5,2.825; 10 4.5,2.825 | smd 2.1 x 2.8: MP1 -7.65,0.475; MP2 7.65,0.475
1X05 = drill 1.016 long: 1 -5.08,0; 2 -2.54,0; 3 0,0; 4 2.54,0; 5 5.08,0
1X07 = drill 1.016 long: 1 -7.62,0; 2 -5.08,0; 3 -2.54,0; 4 0,0; 5 2.54,0; 6 5.08,0; 7 7.62,0
R0805 = smd 1.3 x 1.5: 1 -0.95,0; 2 0.95,0
M0805 = smd 1.3 x 1.6: 1 -0.95,0; 2 0.95,0
RESC2012X50N = smd 0.95 x 1.45: 1 -1,0; 2 1,0
SOP50P490X110-10N = smd 1.45 x 0.28: 1 -2.16,1; 2 -2.16,0.5; 3 -2.16,0; 4 -2.16,-0.5; 5 -2.16,-1; 6 2.16,-1; 7 2.16,-0.5; 8 2.16,0; 9 2.16,0.5; 10 2.16,1

### Placement (x,y rotation side)
5V_ROTOR  9.3,36.6 0 top
BATT_-  78,4.7 180 top
C2  4.2,112.7 90 top
C4  29.6,13.5 180 top
CANH  97.7,14.5 0 top
CANH1  7,75 0 top
CANL  94.5,14.7 0 top
CANL1  7,78 0 top
GND  8.1,41.7 0 top
IC1  128.1,11.4 0 top
IC3  13.3,106.7 0 top
J1  141.4,69.68 0 top
J2  141.4,26.49 0 top
J3  118.6,19.9 270 top
J4  144.4,180.6 180 top  (outside the outline)
J5  144,110.3 180 top
LED1  29.3,18.2 90 top
MODULO_50V_IN  154.4,5.8 0 top
MODULO_GND_IN1  154.4,9.5 0 top
MOSFET  21.9,31.6 0 top
P2  177.6,108.2 180 top  (outside the outline)
PIN1  151.5,59.7 270 top
PIN2  111.3,112.9 90 top
PIN3  122.8,112.9 270 top
R1  16.4,30 90 top
R2  140.4,13.2 180 top
R3  3.7,106.1 270 top
R4  2.9,100.8 90 top
R5  16,20.6 0 top
R6  31.1,26.5 270 top
R7  145.7,13 0 top
R8  15.9,26.1 0 top
R9  19.7,18.9 0 top
R10  23.9,18.8 180 top
ROTOR_POWER+  68.9,3 180 top
ROTOR_POWER_-  63.1,4.6 180 top
SW_50V_OUT  154.4,2.1 0 top
U1  21.7,24.5 0 top
ZENIT_POWER_+  3.9,59.3 180 top
ZENIT_POWER_-  3.9,64.4 180 top

### Tracks (layer width: path | path; a pad name or v marks a point on that pad's centre or on a via)
3V3  (via drill 0.7)
  Top 0.61: v111.1,25.6 J3.1 113.89,25.61 v112.5,27 112.5,28.8 142.8,59.1 | v107.6,22.1 107.2,21.7 107.2,11.8 110.1,10.2 119.2,10.2 122.77,10.66 IC1.3 | PIN1.3 143.4,59.7 142.8,59.1 | v129.2,76.1 129.2,70 140.1,59.1 142.8,59.1
  Bottom 0.61: v107.6,22.1 v111.1,25.6
  Bottom 0.813: v129.2,76.1 129.2,92.3 119.4,102.1 119.4,106.8 120.4,107.8 122.78,107.8 PIN3.6
3V3-I2C  (via drill 0.4, 0.6)
  Top 0.2: 142.2,26.6 146.9,26.6 147.2,26.9 J2.69 v147.2,30.7 | 142.2,26.6 142,26.8 J2.43 | J2.23 138,26.6 142.2,26.6
  Top 0.61: R7.2 v150,14 | C2.2 7.88,113.52 9.2,112.2 9.2,106.9 9,106.7 7.62,106.7 IC3.2 7.33,106.4 R3.1 1.6,107.1 1.2,106.7 1.2,101.3 1.4,101.1 1.4,100.2 1.4,99.6 1.6,99.8 R4.1
  Top 1.016: v4.1,95.4 1.4,97.1 1.4,100.2
  Route15 0.61: v147.2,30.7 147.9,31.4 151.4,31.4 152.8,30 152.8,19.3 151,15.5 v150,14
  Bottom 1.016: v4.1,95.4 4.2,88.9 3.9,69.2 10.7,62.2 10.5,55.6 9.2,53.3 9.3,45.7 13.2,42.2 13,19.4 22.1,9.5 80.6,9.4 85.8,8 145.1,7.6 149.3,11.8 v150,14
5V_ROT
  Bottom 0.813: PIN1.2 152.06,62.24 153.8,60.5 153.8,56 153.7,55.9 153.7,51.7 153.6,47.9 153.5,13.5 146.4,6 84.7,6 79.1,7.8 62.5,7.7 60.1,7 21.2,7.6 9.3,19.5 5V_ROTOR.MP
BATT+50V
  Bottom 1.422: 68.4,3.2 ROTOR_POWER+.MP | ZENIT_POWER_+.MP 3.9,17.5 19.7,1.9 66,1.6 ROTOR_POWER+.MP | MODULO_50V_IN.MP SW_50V_OUT.MP 154,1.7 67.6,1.7 ROTOR_POWER+.MP
CAN1RX  (via drill 0.4, 0.6)
  Top 0.2: v143.6,74.1 J1.51 143.6,70.5
  Top 0.406: IC1.4 124.36,9.5 v123.6,9.2 | v128.8,14.98 128.78,15 130.6,15
  Top 0.61: 131.4,14.9 130.6,15 v128.8,14.98 146.5,14.7 154.2,22.2 154.1,76.3 152.1,78.3 v149.7,78.3
  Route15 0.406: 123.6,9 v123.6,9.2 123.6,10.1 124.1,10.6 126.6,10.6 128.8,12.8 v128.8,14.98
  Bottom 0.813: v143.6,74.1 147.8,78.3 v149.7,78.3
CAN1TX  (via drill 0.6)
  Top 0.2: J1.49 143.2,72.7 142.4,73.5 v142.4,77.7
  Top 0.406: 126.3,16.3 125.9,16.7 124.1,16.7 123.8,16.4 123.8,13.8 124.3,13.3 IC1.1
  Top 0.61: 126.3,16.3 146.4,16.3 153,23 152.7,48.7 v146.2,55.2
  Route15 0.61: v146.2,55.2 146.2,73.9 v142.4,77.7
CANH  (via drill 0.4)
  Top 0.2: v124.7,15.5 125.9,15.5 129,12.1 IC1.7
  Top 0.305: 130.72,12.1 IC1.7
  Top 0.406: J5.9 138.92,173.58 136.2,176.3 136.2,180.3 137.8,181.9 139.29,181.9 J4.9
  Route15 0.2: v124.7,15.5 122.3,12.5 121,11.7 100.3,12 CANH.MP
  Route15 0.305: CANH1.MP 10.9,75 17.6,68.3 17.6,54.7 20.7,48.5 23.2,44.4 27.4,37 29.5,33.7 46,19 51.1,14.5 55.3,12.4 94.3,12.4 CANH.MP 97.7,15.6 99.2,17.7 100.7,20.7 109.8,27.5 113.2,30.6 116.5,33.2 118.4,34.4 124.5,40.5 124.5,52 127.6,54.6 127.6,89.3 138.8,100.5 138.8,104 142.8,108 142.8,109.7 142.2,110.3 140.19,110.3 J5.9
CANL  (via drill 0.4, 0.5)  (1 unrouted)
  Top 0.2: 130.69,10.8 129.6,10.8 128.8,11.7 126.8,13.9 126.2,14.5 v125.5,14.8
  Top 0.305: v141.46,108.66 141.46,108.96 141.5,109 | 130.69,10.8 IC1.6
  Top 0.406: J5.8 141.46,109.54 140.2,110.8 140.2,175.2 141.9,176.9 141.9,179.29 J4.8
  Route2 0.2: v97.2,11.9 CANL.MP
  Route15 0.2: v125.5,14.8 124.6,14.5 124.1,14.1 122.5,12.1 121.2,11.3 100.1,11.6 v97.2,11.9
  Route15 0.305: v141.46,108.66 141.46,107.36 138.3,104.2 138.3,100.8 127,89.5 127,54.8 124,52.2 124,40.8 118.2,35 116,33.5 112.7,30.9 109.3,27.8 100.4,21.2 100,20.7 98.8,18 97.4,16.1 CANL.MP 93.9,12.9 55.4,13 51.3,15 46.5,19.3 30,34 28,37.4 23.8,44.7 21.2,48.8 18.3,54.9 18.2,68.5 9,78.2 7.5,78.1 CANL1.MP
CS  (via drill 0.6, 0.8)
  Top 0.2: J2.36 140.4,23.6 139.7,22.9
  Top 0.61: PIN3.2 122.72,117.9 120.2,117.9 119,116.7 119,104.7 126.9,96.8 v126.9,50.3 | v126.9,30.7 126.9,28.6 132.6,22.9 139.7,22.9
  Bottom 0.61: v126.9,50.3 v126.9,30.7
GATE_PWR
  Top 0.305: R6.1 20.55,27.45 19.4,28.6 19.4,29.67 MOSFET.4
GND  (via drill 0.4, 0.6, 0.7, 0.9)  (1 unrouted)
  Top 0.406: J5.5 144,115.1 145.7,116.8 145.7,180.3 144.4,181.6 J4.5 | IC1.2 125.58,12 127.4,12 128.4,11 128.4,7.9 128.5,7.8 136.7,7.8 139.2,10.3 v141.3,10.3 142.7,8.9 v142.7,4.5
  Top 0.61: J3.9 113.77,20.54 v113,19.6 | J3.5 116.54,23.1 112.8,23.1 112.7,23.2 112.7,24.3 112.78,24.38 | J3.3 116.53,24.38 112.78,24.38 | 112.78,24.38 111.98,24.38 v110.5,22.9 | v141.3,10.3 R2.1 | IC3.1 6.7,109.2 | v3.6,109.2 IC3.1 | C2.1 6.88,109.2 IC3.1 | IC1.2 v124,11.9
  Bottom 0.406: 1.6,95.4 1.6,95.5 | J4.10 139.32,115.62 136.5,112.8 136.5,109.9 136.5,109.8 137.3,109 138.89,109 J5.10 | J4.7 141.86,181.34 143.1,180.1 143.1,176.4 141.5,174.8 141.5,111.61 J5.7 | v142.7,4.5 142.6,4.5
  Bottom 0.61: J5.10 J5.7 | v124,11.9 123.1,11.8 v113,19.6 | PIN3.5 124.7,109.9 136.5,109.9
  Bottom 0.813: v3.59,109.2 v3.6,109.2 1.6,107.2 1.6,95.5 1.6,66.7 4.4,63.9 | 147.2,3.9 144.5,3.9 | GND.MP 6.8,41.7 6.5,42
  Bottom 1.422: J5.7 142.7,111.6 J5.5 144,112.9 144.9,113.8 151,113.8 155.5,109.3 155.5,54.4 155.8,51.5 155.5,51.2 155.5,30.9 155.2,30.6 155.2,13.9 155.1,13.8 155.1,11.1 154.4,10.4 MODULO_GND_IN1.MP 152.8,9.5 147.2,3.9 80.8,3.9 BATT_-.MP 74.4,5.7 65.9,5.7 64.1,4.9 ROTOR_POWER_-.MP 20.6,5 6.5,19 6.5,42 6.5,57.2 7.7,58.4 7.7,60.6 4.4,63.9 ZENIT_POWER_-.MP
  pour Bottom: 113.9,79.1 164.9,79.1 166.2,77.8 166.2,8 165.1,6.9 165.1,2.4 157.1,-5.6 111.2,-5.6 108.3,-2.7 108.3,73.5
I2C0-SCL  (via drill 0.4, 0.6)
  Top 0.2: v142.9,66.3 142.4,66.8 J1.46
  Top 0.61: R4.2 7.37,101.8 IC3.4 6.08,101.58 v4.7,100.8
  Route2 0.2: v123.2,46.9 v125.6,49.5
  Route15 0.2: 121.8,41.1 122.1,41.4 v123.2,46.9 | v125.6,49.5 126,50.4 126.5,51.2 127.6,52.4 141.4,64.4 142.2,64.3 142.9,64.9 v142.9,66.3
  Route15 0.305: 10.9,99.5 10.9,81.4 19.4,72.9 19.4,55.8 22.8,49.2 25.2,45.3 31.4,34.7 45.5,22.6 51.3,17.4 55.1,15.7 68.6,14.5 84.1,14.4 91.9,15.2 95.6,18 100.3,22.3 109.8,29.8 117.3,36.6 121.8,41.1
  Route15 0.61: v4.7,100.8 9.6,100.8 10.9,99.5
I2C0-SDA  (via drill 0.4, 0.6)
  Top 0.2: J1.44 v142,65.6
  Top 0.61: R3.2 7.3,104.4 IC3.3 5.82,104.12 v4.6,103.5
  Route2 0.305: v125.5,51.2 v122.8,48.5
  Route15 0.305: 11.8,92.3 11.8,81.6 20.3,72.8 20.4,55.8 26.5,44.9 32,35.2 51.6,18.2 55.2,16.5 68.7,15.3 84.1,15.2 91.6,15.9 100.5,23.6 109.4,30.4 121.4,41.9 v122.8,48.5 | v142,65.6 v125.5,51.2
  Route15 0.61: v4.6,103.5 10.6,103.2 11.9,101.9 11.9,92.4 11.8,92.3
N$2  (via drill 0.6)
  Top 0.305: U1.7 28.3,24 v29.8,22.5 | v29.8,19.5 LED1.A@1
  Bottom 0.305: v29.8,22.5 v29.8,19.5
N$11
  Top 0.305: R5.2 19,20.6 21.2,22.8 21.2,24.5 20.7,25 U1.2
  Top 0.61: R9.1 17.5,18.9 17,19.4 17,20.55 R5.2
N$12  (via drill 0.6)
  Top 0.305: 22.4,25.7 22.4,23.2 23.1,22.5 | 23.1,22.5 24.5,21.1 30.3,21.1 32.4,19 32.4,16.9 30.4,14.9 25.6,14.9 22.9,17.6 22.9,18.75 R10.2 | U1.3 20.5,24.5 20.7,24.3 20.7,23 19.7,22 v18.7,22 | v24.4,22.5 23.1,22.5
  Top 0.61: R1.1 17.15,29.05 19.4,26.8 21.3,26.8 22.4,25.7
  Bottom 0.305: v18.7,22 18.7,21.4 19.1,21 19.9,21 20.7,21.8 23.7,21.8 v24.4,22.5
N$13
  Top 0.305: R8.2 20.8,26.1 21.9,25 21.9,22.8 24.3,20.4 26.6,20.4 LED1.C@1
N$14
  Top 0.305: U1.10 31.05,25.5 R6.2
N$15
  Top 0.406: R2.2 138.85,13.8 133.9,13.8 132.2,13.3 IC1.8
N$23
  Top 0.61: 14.9,25.9 15,26 15,26.2
PWM5  (1 unrouted)
  Top 0.406: J4.4 146.94,113.06 147.8,112.2 147.8,110.29 J5.4 146.4,108.89 146.4,103
PWM9_SYNC  (via drill 0.4, 0.7)
  Top 0.2: v146.8,23.6 J2.68 | J5.6 144,107.1 v143.8,103.7
  Top 0.406: J5.6 144,109.6 142.7,110.9 142.7,175 144.4,176.7 J4.6
  Top 0.61: v144.6,10 R7.1
  Route15 0.2: v144.6,10 143.7,10.9 v146.8,23.6 146,23.6 145.5,24.1 145.5,31.1 146.9,32.5 149,32.5 149.6,33.1 149.6,65.5 152.5,68.4 152.5,91.7 v143.8,103.7
RESET  (via drill 0.5, 0.7)
  Top 0.2: v148,75 J1.73
  Top 0.61: v122.97,20.52 120.65,20.52 J3.10
  Route15 0.305: v122.97,20.52 131.52,20.52 149,38 149,66.6 151.7,69.3 151.7,72.4 149.1,75 v148,75
SAO  (via drill 0.4)
  Top 0.2: J2.40 v141.2,22.1
  Route2 0.2: v141.2,22.1 140.5,21.9 130.5,21.9 128.2,24.2 128.1,24.9 | 126.7,94.9 126.7,112.3 124.8,114.2 121.7,114.2 119.8,116.1 119.8,119.7 120.55,120.45
  Route2 0.254: PIN3.1 120.62,120.52 120.55,120.45 | 126.7,94.9 126.7,65.5 128.1,64.6 128.1,24.9
SCL  (via drill 0.4)
  Top 0.2: J2.38 140.8,22.8 140.4,22.4 140.4,20.4 v140.2,20.2
  Route2 0.2: v140.2,20.2 139,21.4 130.1,21.4 129.3,22.2 129.3,22.3 127.5,24.1 127.5,29.8 127.7,30 127.7,63.6 126,65.3 126,109.7 PIN3.4
SDA  (via drill 0.4)
  Top 0.2: J2.42 141.6,24.4 v142.5,23.5
  Route2 0.2: v142.5,23.5 140.8,22.8 140.1,22.3 137.2,22.3 | PIN3.3 122.84,115.4 124.8,115.4 127.4,112.8 127.4,106.6 127.3,66 128.8,65.1 128.7,47.3
  Route2 0.254: 137.2,22.3 131,22.3 128.8,24.5 128.7,47.3
TCK/SWCLK  (via drill 0.4, 0.7)
  Top 0.2: J1.77 148.8,72.2 148.6,72.4 v148.6,72.5
  Top 0.61: v122.98,24.36 120.65,24.36 J3.4
  Route15 0.2: v148.6,72.5 147.7,71.6 147.7,38.3 133.76,24.36 v122.98,24.36
TDO/SWO  (via drill 0.4)
  Top 0.2: J1.79 150.1,71.9 v150.1,72.3 | v123,22.5 122.42,23.07 J3.6
  Route15 0.2: v150.1,72.3 150.8,71.6 150.8,69.3 148.3,66.8 148.3,38.2 132.6,22.5 v123,22.5
TMS/SWDIO  (1 unrouted)
VBAT
  Top 0.305: U1.8 U1.9 29.3,25 30.3,24 32.3,24 33.7,25.4 33.7,27.3 31.3,29.7 MOSFET.5
  Top 0.61: MOSFET.5 MOSFET.6 MOSFET.7 MOSFET.8
VBAT_RAW  (via drill 0.6)
  Top 0.305: 18,23.3 18,25 18.5,25.5 U1.1 | C4.2 23.8,13.5 20.65,16.65 R9.2 20.7,18.95 v20.7,20.6 | U1.6 24.8,23.5 v25.8,22.5 | v14.6,22.2 14.6,23.2 14.95,23.55
  Top 0.61: 18,23.3 17.2,22.5 16,22.5 14.95,23.55 R8.1 14.95,29.5 R1.2 MOSFET.3 MOSFET.2 MOSFET.1
  Bottom 0.305: v25.8,22.5 25.8,20.9 24.8,19.9 22.1,19.9 21.4,20.6 v20.7,20.6 20.3,20.2 16.4,20.2 v14.6,22.2

### Text on the board
tNames: 9 | 7 | 7 | 5 | 5 | 3 | 1 | 10 | 8 | 6 | 4 | 2 | K1_ROT_V0.1_rev4.0 | SAO | SOX | CS | SCX | SDA | 9 | 7 | 5 | 3 | 1 | INT1 | SCL | INT2 | GND | P1 | OCS | 3V3 | 10 | 8 | 6 | 4 | 2 | VIN | C1 | 330UF | MOT - | VIN-5V | MOT + | 100UF | N/C | BAT - | MOT - | MOT + | BAT +
tValues: FRONT